# Altium schematic sheet P1.schdoc
size 420 x 298 mm; Symbol: Sheet-Symbol_A3; Convert to PCB: yes; Add into BOM: yes; Company: 深圳嘉立创科技发展有限公司; Drawed: 嘉立创EDA; Reviewed: 嘉立创EDA; Version: V0.1; Page Size: A3; @Project Name: DAPlink; @Page Count: 1; @Update Date: 2023-07-25; @Create Date: 2023-07-25; @Schematic Name: Schematic2; Part Number: JLCPCB-001; @Page No: 1; @Page Name: P1; Device: Sheet-Symbol_A3
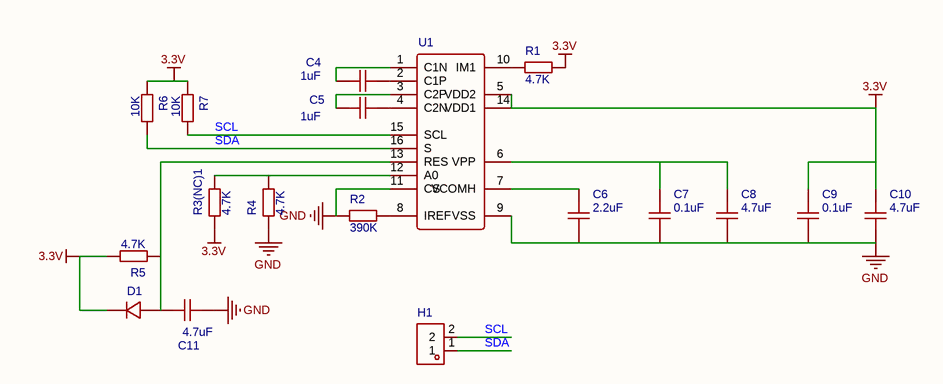
[diagram p0: P1.schdoc]

## Parts
C4  value 1uF  [C0402]
C5  value 1uF  [C0402]
C6  value 2.2uF  [C0402]
C7  value 0.1uF  [C0402]
C8  value 4.7uF  [C0402]
C9  value 0.1uF  [C0402]
C10  value 4.7uF  [C0402]
C11  value 4.7uF  [C0402]
D1  (no value)  [SOD-323_L1.8-W1.3-LS2.5-RD]
H1  PZ254V-11-02P  [HDR-TH_2P-P2.54-V-M]  (value not drawn)
R1  value 4.7K  [R0402]
R2  value 390K  [R0402]
R3(NC)1  value 4.7K  [R0402]
R4  value 4.7K  [R0402]
R5  value 4.7K  [R0402]
R6  value 10K  [R0402]
R7  value 10K  [R0402]
U1  (no value)  [OLED]

## Nets
3.3V: C9.2 C10.2 D1.1(K) R1.2 R3(NC)1.1 R5.2 R6.1 R7.1 U1.5(VDD2) U1.14(VDD1)
GND: C6.1 C7.1 C8.1 C9.1 C10.1 C11.1 R2.1 R4.1 U1.9(VSS) U1.11(CS)
SCL: H1.2 R7.2 U1.15(SCL)
SDA: H1.1 R6.2 U1.16(S)
NetC4_1: C4.1 U1.2(C1P)
NetC4_2: C4.2 U1.1(C1N)
NetC5_1: C5.1 U1.4(C2N)
NetC5_2: C5.2 U1.3(C2P)
NetC6_2: C6.2 U1.7(VCOMH)
NetC7_2: C7.2 C8.2 U1.6(VPP)
NetC11_2: C11.2 D1.2(A) R5.1 U1.13(RES)
NetR1_1: R1.1 U1.10(IM1)
NetR2_2: R2.2 U1.8(IREF)
NetR3(NC)1_2: R3(NC)1.2 R4.2 U1.12(A0)

## Notes on the sheet
- 1
- 2
- 3
- 4
- 5
- 6
- A
- B
- C
- Update Date
- 2023-07-25
- D
- Schematic
- Page
- Schematic2
- P1
- Create Date
- Part Number
- JLCPCB-001
- Reviewed
- Drawed
- 嘉立创EDA
- DAPlink
- VER
- V0.1
- SIZE
- A3
- PAGE
- 深圳嘉立创科技发展有限公司
- OF

## Library data of the parts
C4-C11 = 0402CG241J500NT: 容值:240pF;精度:±5%;额定电压:50V;温度系数:-;; Manufacturer: FH(风华); AddInBom: yes; ModelId: 36a51122f27c49738f86b3bfa98863e0; ModelName: C0402_L1.0-W0.5-H0.5; ModelTransform: 39.37,19.685,0,0,0,0,0,0,0; Tolerance: ±5%; Voltage Rated: 50V; Symbol: 0402CG241J500NT; Device: 0402CG241J500NT; LCSC Part Name: 240pF ±5% 50V; SupplierPart: C1322356; ManufacturerPart: 0402CG241J500NT; Supplier Footprint: 0402; JLCPCB Part Class: Extended Part; Datasheet: https://atta.szlcsc.com/upload/public/pdf/source/20200305/C486355_26A10D38EF8C2A5C37091D0039909270.pdf; Supplier: LCSC; ConvertToPcb: yes; FootprintName: C0402; Temperature Coefficient: -
D1 = 1N4007WS: 二极管配置:-;直流反向耐压(Vr):1kV;平均整流电流(Io):1A;正向压降(Vf):1.1V@1A;反向电流(Ir):5A@1kV;; Manufacturer: MDD; Reverse Leakage Current: 5A@1kV; AddInBom: yes; ModelId: e9dd044ee7bf4221b3b795eb56bce7c0; ModelName: SOD-323_L1.7-W1.3-H1.1-LS2.5; ModelTransform: 98.9,51.2,0,180,0,0,1,0,0; Reverse Voltage (Vr): 1kV; Average Rectified Current (Io): 1A; Symbol: 1N4007WS; Device: 1N4007WS; LCSC Part Name: 1kV 1A 1.1V@1A; SupplierPart: C193404; ManufacturerPart: 1N4007WS; Supplier Footprint: SOD-323; JLCPCB Part Class: Extended Part; Datasheet: https://atta.szlcsc.com/upload/public/pdf/source/20180525/C193404_0C623596A90FA1D1FBDCFE625FBC3C97.pdf; Supplier: LCSC; ConvertToPcb: yes; FootprintName: SOD-323_L1.8-W1.3-LS2.5-RD; Diode Configuration: -; Forward Voltage (Vf@If): 1.1V@1A
H1 = PZ254V-11-02P: 排数:单排;总PIN位数:2;间距:2.54mm;插针结构:1x2P;行距:-;安装类型:直插;圆针/方针:方针;额定电流:-;额定电压:-;配合针长度:6mm;塑高:2.5mm;端接针长度:3mm;触头材质:黄铜;触头镀层:-;工作温度范围:-40℃~+105℃;颜色:黑色;; Manufacturer: XFCN(兴飞); AddInBom: yes; ModelId: e35305ec3aa84b66b849f914b715e73f; ModelName: HDR2.54-M-LI-1X2P; ModelTransform: 200,100,0,0,0,0,0,0,-118.11; Pitch: 2.54mm; Pin Structure: 1x2P; Circluar Pins/Square Pins: 方针; Symbol: PZ254V-11-02P; Device: PZ254V-11-02P; LCSC Part Name: 2.54mm 1x2P 直插 方针; SupplierPart: C492401; ManufacturerPart: PZ254V-11-02P; Supplier Footprint: 直插,P=2.54mm; JLCPCB Part Class: 扩展库; Datasheet: https://atta.szlcsc.com/upload/public/pdf/source/20200309/C492401_A812433581A9B211A7FFA413ADDFF0E5.pdf; Supplier: LCSC; ConvertToPcb: yes; FootprintName: HDR-TH_2P-P2.54-V-M; Number of Rows: 单排; Number of Pins: 2; Row Spacing: -; Mounting Type: 直插; Current Rating (Max): -; Voltage Rating (Max): -; Length of Mating Pin: 6mm; Insulation Height: 2.5mm; Length of End Connection Pin: 3mm; Contact Material: 黄铜; Contact Plating: -; Operating Temperature Range: -40℃~+105℃; Color: 黑色
R1 R2 R3(NC)1 R4-R7 = RC0402FR-07511KL: 电阻类型:厚膜电阻;阻值:511kΩ;精度:±1%;功率:62.5mW;温度系数:±100ppm/;最大工作电压:50V;工作温度范围:-55~+155;; Manufacturer: YAGEO(国巨); AddInBom: yes; ModelId: 671aefced39d4c318694bba8bd8efd39; ModelName: R0402_L1.0-W0.5-H0.5; ModelTransform: 39.37,19.685,0,0,0,0,0,0.0005,0; Tolerance: ±1%; Power(Watts): 62.5mW; Overload Voltage (Max): 50V; Symbol: RC0402FR-07511KL; Temperature Coefficient: ±100ppm/; Operating Temperature Range: -55~+155; Device: RC0402FR-07511KL; LCSC Part Name: 511kΩ ±1% 62.5mW; SupplierPart: C163461; ManufacturerPart: RC0402FR-07511KL; Supplier Footprint: 0402; JLCPCB Part Class: Extended Part; Datasheet: https://atta.szlcsc.com/upload/public/pdf/source/20180111/C163461_15156544527551258982.pdf; Supplier: LCSC; ConvertToPcb: yes; FootprintName: R0402; Type: 厚膜电阻
U1 = OLED: Symbol: 1.3OLED; ConvertToPcb: yes; Device: OLED; AddInBom: yes; FootprintName: OLED